# Altium schematic sheet IDC_Tester_v1_LED.SchDoc
size 420 x 297 mm; SheetNumber: 4; SheetTotal: 10
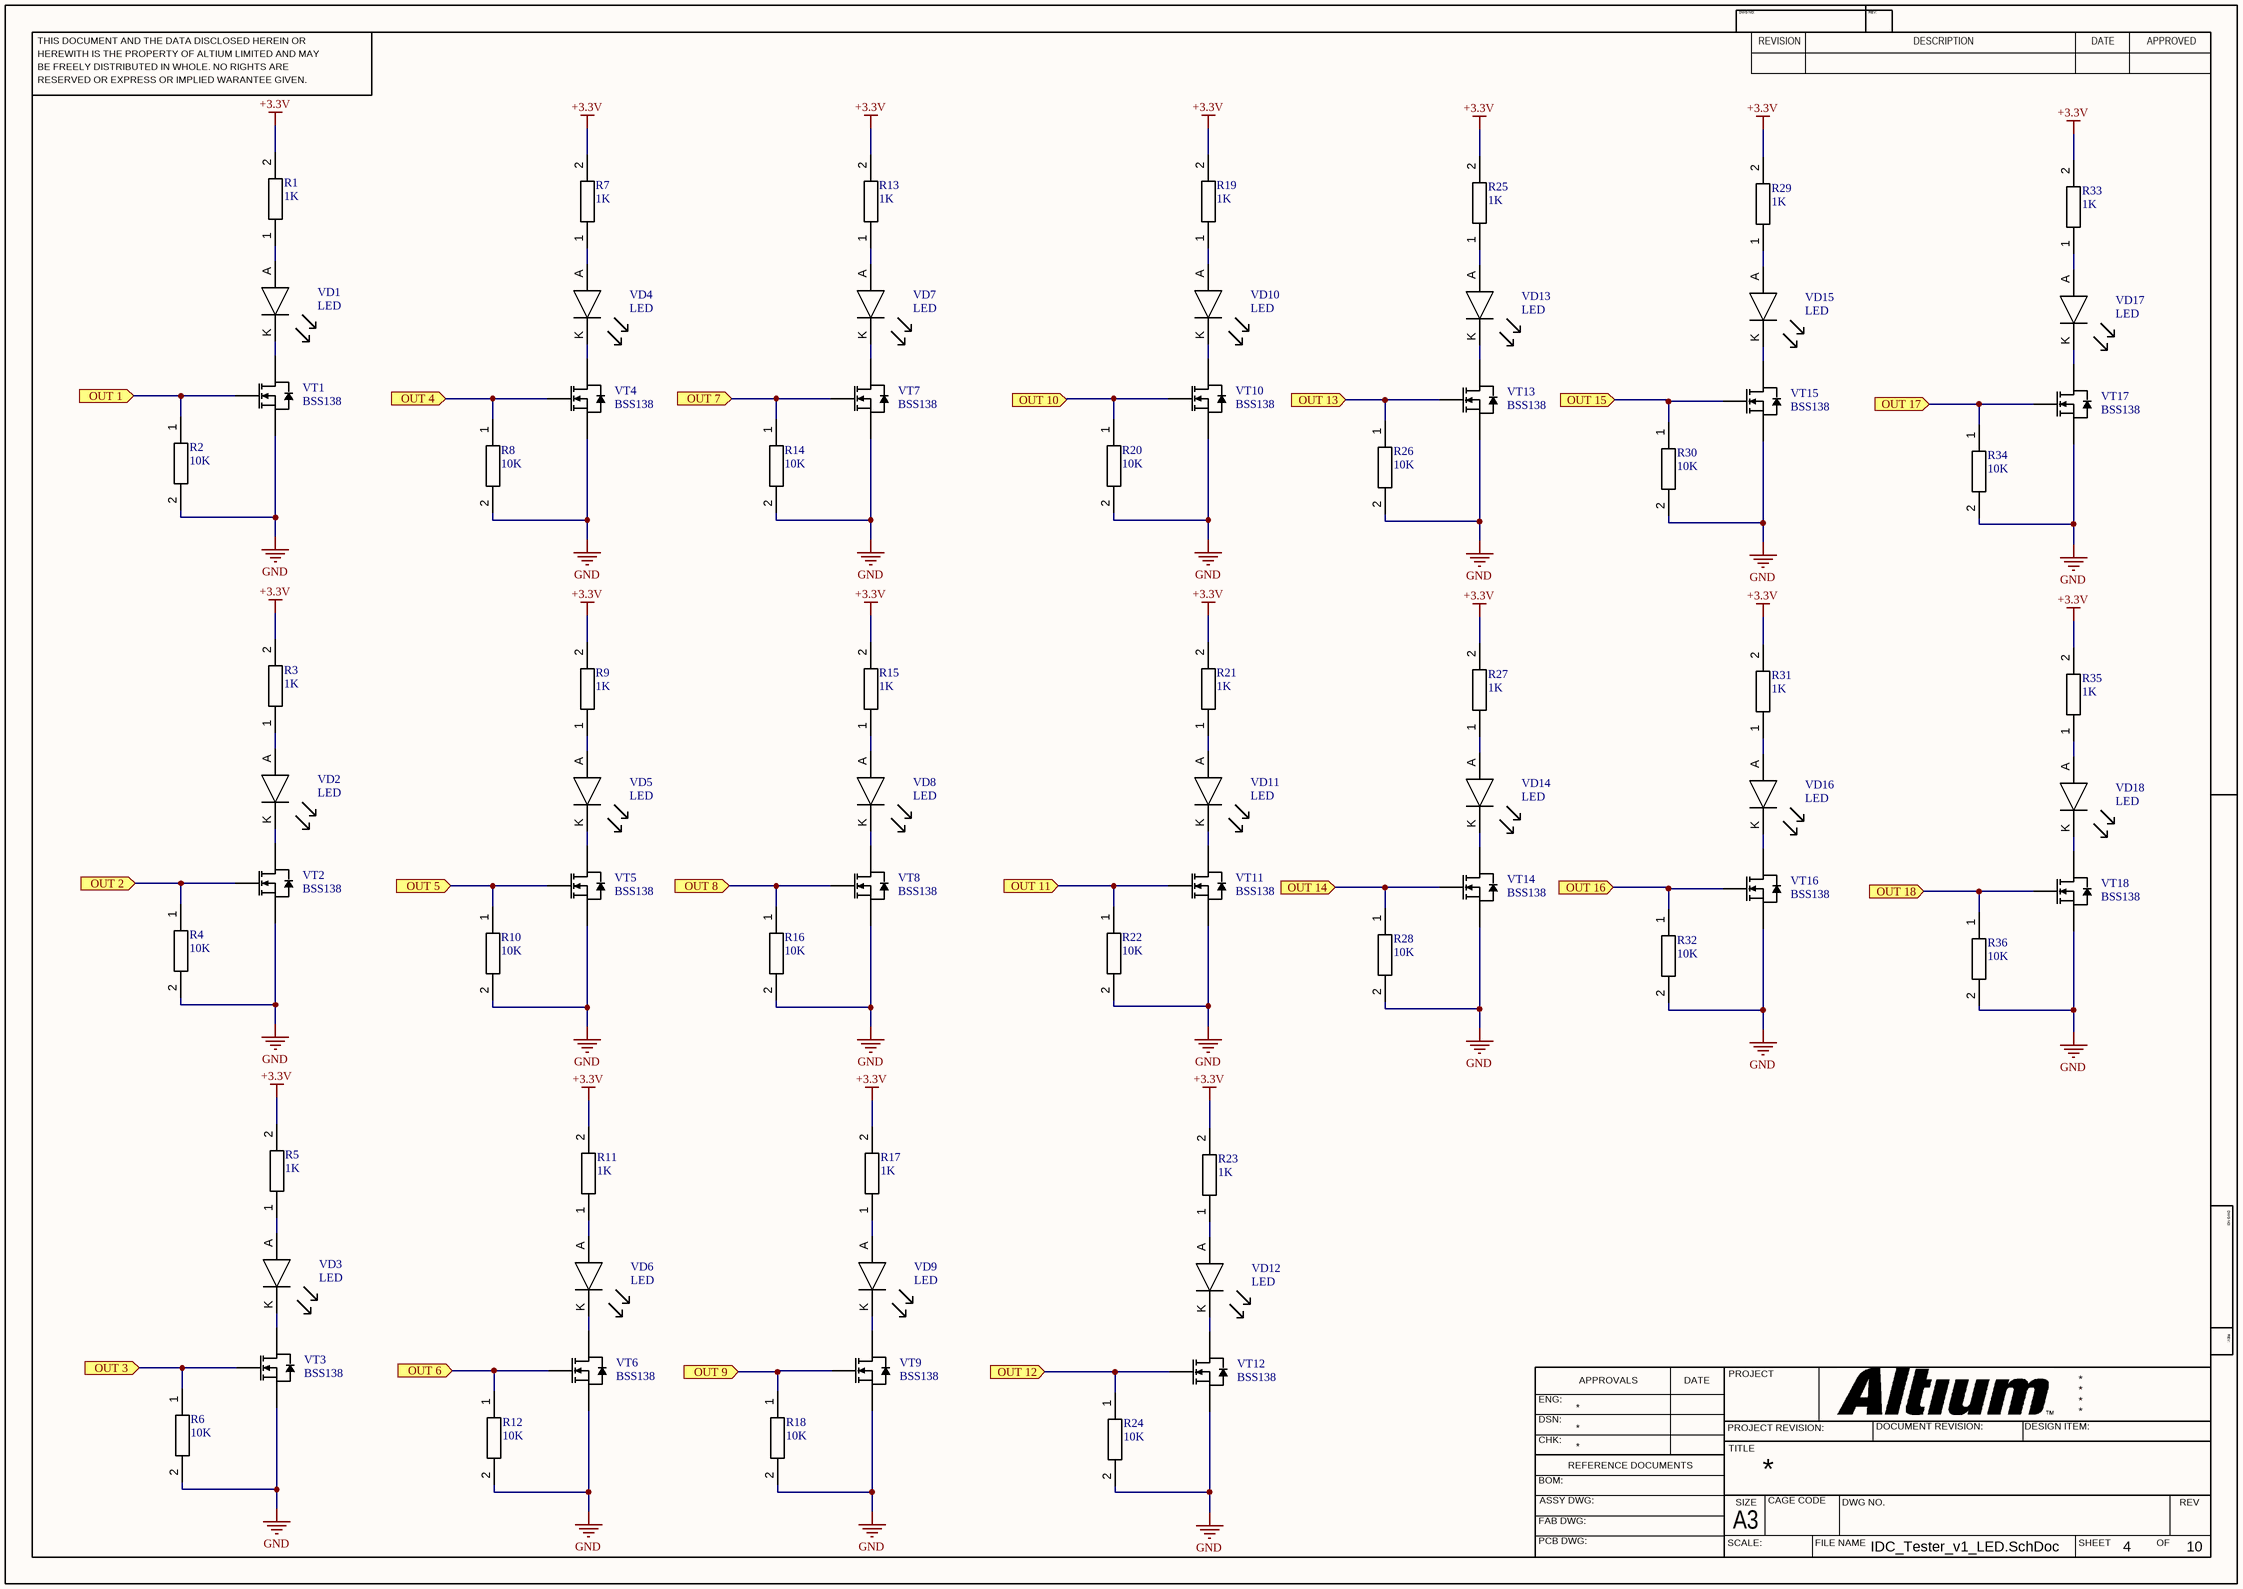
[diagram p0: IDC_Tester_v1_LED.SchDoc]

## Parts
R1  1K  [Resistor 0603]
R2  10K  [Resistor 0603]
R3  1K  [Resistor 0603]
R4  10K  [Resistor 0603]
R5  1K  [Resistor 0603]
R6  10K  [Resistor 0603]
R7  1K  [Resistor 0603]
R8  10K  [Resistor 0603]
R9  1K  [Resistor 0603]
R10  10K  [Resistor 0603]
R11  1K  [Resistor 0603]
R12  10K  [Resistor 0603]
R13  1K  [Resistor 0603]
R14  10K  [Resistor 0603]
R15  1K  [Resistor 0603]
R16  10K  [Resistor 0603]
R17  1K  [Resistor 0603]
R18  10K  [Resistor 0603]
R19  1K  [Resistor 0603]
R20  10K  [Resistor 0603]
R21  1K  [Resistor 0603]
R22  10K  [Resistor 0603]
R23  1K  [Resistor 0603]
R24  10K  [Resistor 0603]
R25  1K  [Resistor 0603]
R26  10K  [Resistor 0603]
R27  1K  [Resistor 0603]
R28  10K  [Resistor 0603]
R29  1K  [Resistor 0603]
R30  10K  [Resistor 0603]
R31  1K  [Resistor 0603]
R32  10K  [Resistor 0603]
R33  1K  [Resistor 0603]
R34  10K  [Resistor 0603]
R35  1K  [Resistor 0603]
R36  10K  [Resistor 0603]
VD1  LED  [Led 0603 - duplicate]
VD2  LED  [Led 0603 - duplicate]
VD3  LED  [Led 0603 - duplicate]
VD4  LED  [Led 0603 - duplicate]
VD5  LED  [Led 0603 - duplicate]
VD6  LED  [Led 0603 - duplicate]
VD7  LED  [Led 0603 - duplicate]
VD8  LED  [Led 0603 - duplicate]
VD9  LED  [Led 0603 - duplicate]
VD10  LED  [Led 0603 - duplicate]
VD11  LED  [Led 0603 - duplicate]
VD12  LED  [Led 0603 - duplicate]
VD13  LED  [Led 0603 - duplicate]
VD14  LED  [Led 0603 - duplicate]
VD15  LED  [Led 0603 - duplicate]
VD16  LED  [Led 0603 - duplicate]
VD17  LED  [Led 0603 - duplicate]
VD18  LED  [Led 0603 - duplicate]
VT1  BSS138  [SOT-23-3]
VT2  BSS138  [SOT-23-3]
VT3  BSS138  [SOT-23-3]
VT4  BSS138  [SOT-23-3]
VT5  BSS138  [SOT-23-3]
VT6  BSS138  [SOT-23-3]
VT7  BSS138  [SOT-23-3]
VT8  BSS138  [SOT-23-3]
VT9  BSS138  [SOT-23-3]
VT10  BSS138  [SOT-23-3]
VT11  BSS138  [SOT-23-3]
VT12  BSS138  [SOT-23-3]
VT13  BSS138  [SOT-23-3]
VT14  BSS138  [SOT-23-3]
VT15  BSS138  [SOT-23-3]
VT16  BSS138  [SOT-23-3]
VT17  BSS138  [SOT-23-3]
VT18  BSS138  [SOT-23-3]

## Ports
OUT 1 (in), OUT 2 (in), OUT 3 (in), OUT 4 (in), OUT 5 (in), OUT 6 (in), OUT 7 (in), OUT 8 (in), OUT 9 (in), OUT 10 (in), OUT 11 (in), OUT 12 (in), OUT 13 (in), OUT 14 (in), OUT 15 (in), OUT 16 (in), OUT 17 (in), OUT 18 (in)

## Nets
+3.3V: R1.2 R3.2 R5.2 R7.2 R9.2 R11.2 R13.2 R15.2 R17.2 R19.2 R21.2 R23.2 R25.2 R27.2 R29.2 R31.2 R33.2 R35.2
GND: R2.2 R4.2 R6.2 R8.2 R10.2 R12.2 R14.2 R16.2 R18.2 R20.2 R22.2 R24.2 R26.2 R28.2 R30.2 R32.2 R34.2 R36.2 VT1.2(S) VT2.2(S) VT3.2(S) VT4.2(S) VT5.2(S) VT6.2(S) VT7.2(S) VT8.2(S) VT9.2(S) VT10.2(S) VT11.2(S) VT12.2(S) VT13.2(S) VT14.2(S) VT15.2(S) VT16.2(S) VT17.2(S) VT18.2(S)
OUT 1: R2.1 VT1.1(G) ; port OUT 1
OUT 2: R4.1 VT2.1(G) ; port OUT 2
OUT 3: R6.1 VT3.1(G) ; port OUT 3
OUT 4: R8.1 VT4.1(G) ; port OUT 4
OUT 5: R10.1 VT5.1(G) ; port OUT 5
OUT 6: R12.1 VT6.1(G) ; port OUT 6
OUT 7: R14.1 VT7.1(G) ; port OUT 7
OUT 8: R16.1 VT8.1(G) ; port OUT 8
OUT 9: R18.1 VT9.1(G) ; port OUT 9
OUT 10: R20.1 VT10.1(G) ; port OUT 10
OUT 11: R22.1 VT11.1(G) ; port OUT 11
OUT 12: R24.1 VT12.1(G) ; port OUT 12
OUT 13: R26.1 VT13.1(G) ; port OUT 13
OUT 14: R28.1 VT14.1(G) ; port OUT 14
OUT 15: R30.1 VT15.1(G) ; port OUT 15
OUT 16: R32.1 VT16.1(G) ; port OUT 16
OUT 17: R34.1 VT17.1(G) ; port OUT 17
OUT 18: R36.1 VT18.1(G) ; port OUT 18
NetR1_1: R1.1 VD1.A
NetR3_1: R3.1 VD2.A
NetR5_1: R5.1 VD3.A
NetR7_1: R7.1 VD4.A
NetR9_1: R9.1 VD5.A
NetR11_1: R11.1 VD6.A
NetR13_1: R13.1 VD7.A
NetR15_1: R15.1 VD8.A
NetR17_1: R17.1 VD9.A
NetR19_1: R19.1 VD10.A
NetR21_1: R21.1 VD11.A
NetR23_1: R23.1 VD12.A
NetR25_1: R25.1 VD13.A
NetR27_1: R27.1 VD14.A
NetR29_1: R29.1 VD15.A
NetR31_1: R31.1 VD16.A
NetR33_1: R33.1 VD17.A
NetR35_1: R35.1 VD18.A
NetVD1_K: VD1.K VT1.3(D)
NetVD2_K: VD2.K VT2.3(D)
NetVD3_K: VD3.K VT3.3(D)
NetVD4_K: VD4.K VT4.3(D)
NetVD5_K: VD5.K VT5.3(D)
NetVD6_K: VD6.K VT6.3(D)
NetVD7_K: VD7.K VT7.3(D)
NetVD8_K: VD8.K VT8.3(D)
NetVD9_K: VD9.K VT9.3(D)
NetVD10_K: VD10.K VT10.3(D)
NetVD11_K: VD11.K VT11.3(D)
NetVD12_K: VD12.K VT12.3(D)
NetVD13_K: VD13.K VT13.3(D)
NetVD14_K: VD14.K VT14.3(D)
NetVD15_K: VD15.K VT15.3(D)
NetVD16_K: VD16.K VT16.3(D)
NetVD17_K: VD17.K VT17.3(D)
NetVD18_K: VD18.K VT18.3(D)

## Notes on the sheet
- THIS DOCUMENT AND THE DATA DISCLOSED HEREIN OR
- HEREWITH IS THE PROPERTY OF ALTIUM LIMITED AND MAY
- DWG NO:
- REVISION
- REV:
- DESCRIPTION
- DATE
- APPROVED
- BE FREELY DISTRIBUTED IN WHOLE. NO RIGHTS ARE
- RESERVED OR EXPRESS OR IMPLIED WARANTEE GIVEN.
- ENG:
- APPROVALS
- PROJECT
- DSN:
- CHK:
- REFERENCE DOCUMENTS
- PROJECT REVISION:
- TITLE
- DOCUMENT REVISION:
- DESIGN ITEM:
- BOM:
- FAB DWG:
- PCB DWG:
- ASSY DWG:
- SCALE:
- A3
- SIZE
- CAGE CODE
- FILE NAME
- DWG NO.
- SHEET
- OF
- REV

## Library data of the parts
R1 R3 R5 R7 R9 R11 R13 R15 R17 R19 R21 R23 R25 R27 R29 R31 R33 R35 = Resistor 1K: Part Number: SMD RES 1K OHM 1%±100ppm/°C 0603 (RMCF0603FT1K00); Added by: viskov2055@gmail.com; Mount_Type: SMD; Solder_Amount: 2; Pkg: 0603; Created at: 13/02/2024; Mount: MOUNT
R2 R4 R6 R8 R10 R12 R14 R16 R18 R20 R22 R24 R26 R28 R30 R32 R34 R36 = Resistor 10K: Part Number: SMD RES 10K OHM 1%±100ppm/°C 0603 (RMCF0603FT10K0); Added by: viskov2055@gmail.com; Mount_Type: SMD; Solder_Amount: 2; Pkg: 0603; Created at: 15/02/2024; Mount: MOUNT
VD1-VD18 = LED: LED Uni-Color Green 515nm 2-Pin SMD T/R; Manufacturer: Kingbright; Manufacturer Part Number: APG1608ZGCK; Lens Style: Flat; Lens Transparency: Clear; Luminous Intensity: 400mcd; Forward Voltage: 3.3V; Test Current: 20mA; Viewing Angle: 130°; Dominant Wavelength: 525nm; Lens Size: 0.8mm; Added by: viskov2055@gmail.com; Solder_Amount: 2; Pkg: 0603; RoHS: Yes; Category: LEDs; Stock 1: 44996; Pricing 1: 1=0,6, 10=0,368, 100=0,2114, 1000=0,16544, 2000=0,15165 (USD); MountType: SMD; Case/Package: 0603; Color: Green; Case Code (Imperial): 0603; Case Code (Metric): 1608; Packaging: Tape and Reel; Length: 1.6mm; Width: 0.8mm; Height: 0.28mm; RoHS Compliant: Yes; ComponentLink1URL: https://datasheet.octopart.com/APG1608ZGCK-Kingbright-datasheet-153682089.pdf?src-supplier=Future+Electronics; ComponentLink1Description: https://datasheet.octopart.com/APG1608ZGCK-Kingbright-datasheet-153682089.pdf?src-supplier=Future+Electronics; ComponentLink2URL: http://www.kingbrightusa.com/images/catalog/SPEC/APG1608ZGCK.pdf?src-supplier=Digikey; ComponentLink2Description: http://www.kingbrightusa.com/images/catalog/SPEC/APG1608ZGCK.pdf?src-supplier=Digikey; ComponentLink3URL: https://datasheet.octopart.com/APG1608ZGCK-Kingbright-datasheet-137408059.pdf?src-supplier=Sager+Electronics; ComponentLink3Description: https://datasheet.octopart.com/APG1608ZGCK-Kingbright-datasheet-137408059.pdf?src-supplier=Sager+Electronics; Supplier Part Number 1: 754-2113-1-ND; Created at: 13/02/2024; Mount: MOUNT; Part Number: APG1608ZGCK; Supplier 1: Digikey
VT1-VT18 = BSS138: N-Channel Logic Level Enhancement Mode Field Effect Transistor; Solder_Amount: 3; Added_by: ma_lubushkin@teslatec.ru; Pkg: SOT-23; Part Number: BSS138; Mount: MOUNT; MountType: SMD; Created_at: 03/12/2019